# EasyEDA Pro project DRV8701视觉双驱（1）.eprj

# Schematic Schematic1
Board Name: Board1; Create Date: 2025-04-27; Page Name: P1; Project Name: DRV8701视觉双驱; Schematic Name: Schematic1; Update Date: 2025-04-28; Company: 嘉立创EDA; Page Size: A4; Version: V1.0
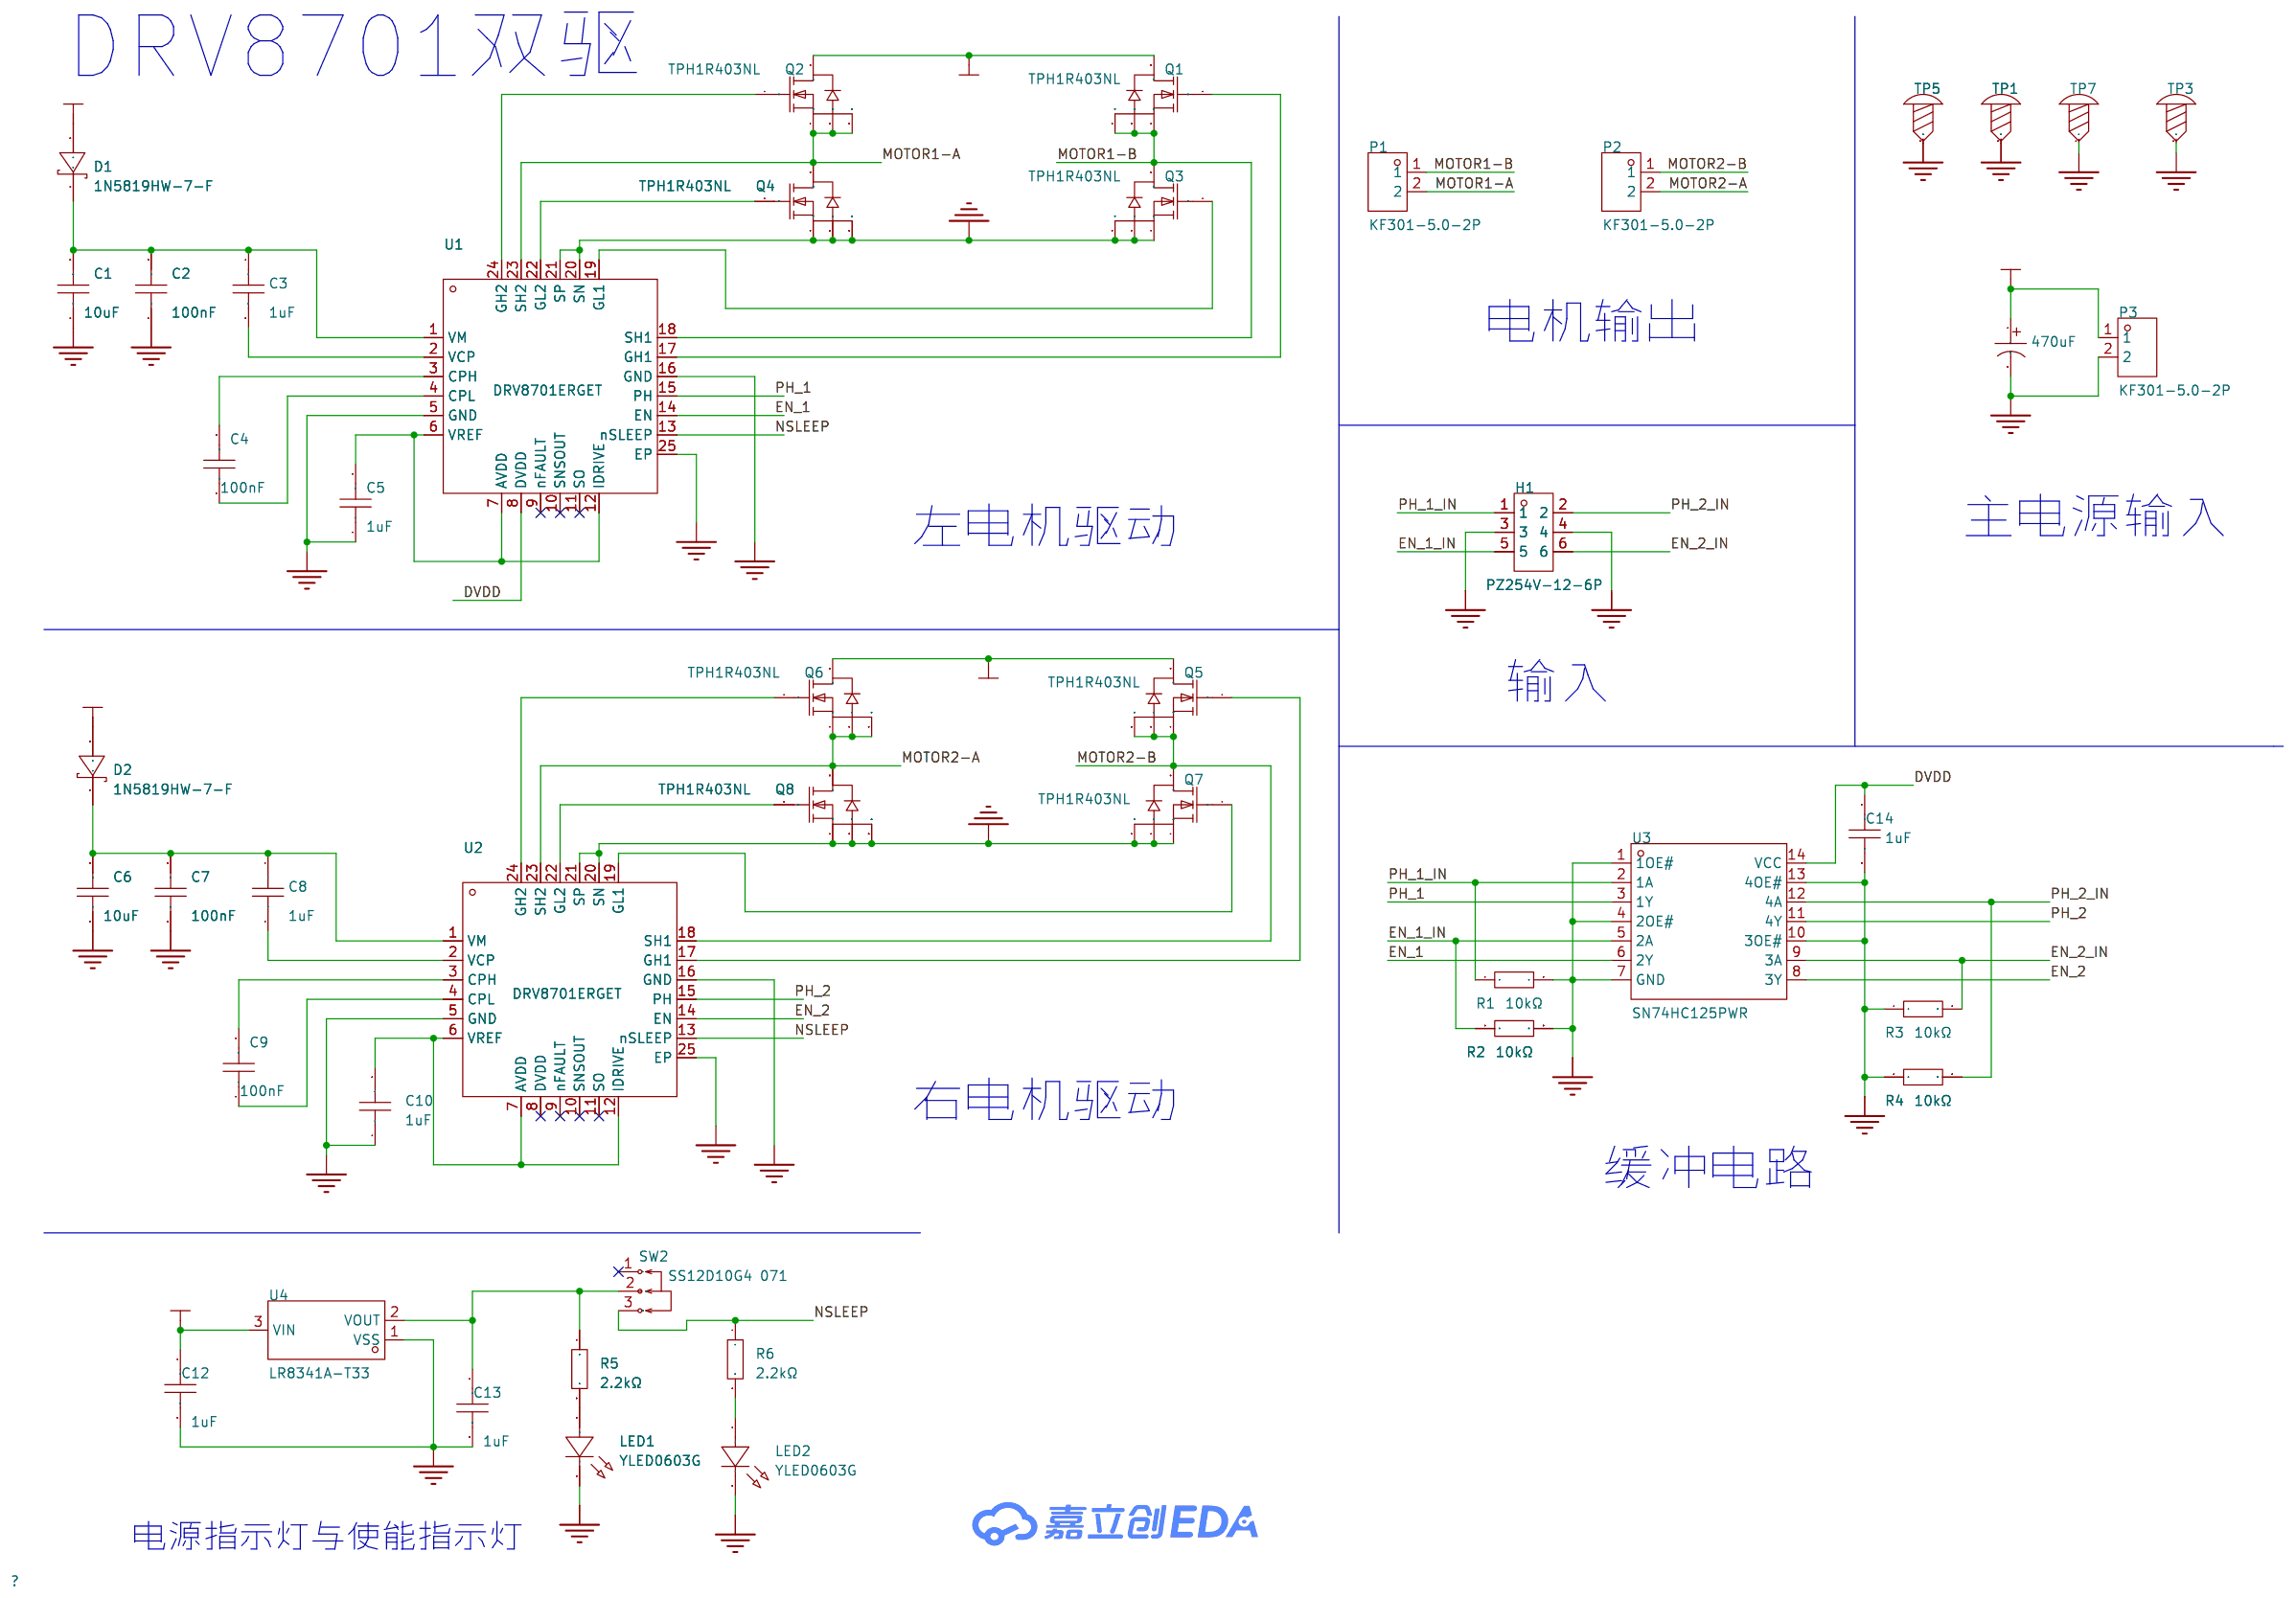
[diagram p0: schematic sheet]

## Parts
C1  10uF  [C0603]
C2  100nF  [C0603]
C3  1uF  [C0603]
C4  100nF  [C0603]
C5  1uF  [C0603]
C6  10uF  [C0603]
C7  100nF  [C0603]
C8  1uF  [C0603]
C9  100nF  [C0603]
C10  1uF  [C0603]
C12  1uF  [C0603]
C13  1uF  [C0603]
C14  1uF  [C0603]
C16  470uF  [CAP-SMD_BD10.0-L10.3-W10.3-LS11.0-R-RD]
D1  1N5819HW-7-F  [SOD-123_L2.7-W1.6-LS3.7-RD]
D2  1N5819HW-7-F  [SOD-123_L2.7-W1.6-LS3.7-RD]
H1  PZ254V-12-6P  [HDR-TH_6P-P2.54-V-M-R2-C3-S2.54]
LED1  YLED0603G  [LED0603-FD]
LED2  YLED0603G  [LED0603-FD]
P1  KF301-5.0-2P  [CONN-TH_P5.00_KF301-5.0-2P]
P2  KF301-5.0-2P  [CONN-TH_P5.00_KF301-5.0-2P]
P3  KF301-5.0-2P  [CONN-TH_P5.00_KF301-5.0-2P]
Q1  TPH1R403NL  [TDSON-8_L5.9-W5.2-P1.27-BL]
Q2  TPH1R403NL  [TDSON-8_L5.9-W5.2-P1.27-BL]
Q3  TPH1R403NL  [TDSON-8_L5.9-W5.2-P1.27-BL]
Q4  TPH1R403NL  [TDSON-8_L5.9-W5.2-P1.27-BL]
Q5  TPH1R403NL  [TDSON-8_L5.9-W5.2-P1.27-BL]
Q6  TPH1R403NL  [TDSON-8_L5.9-W5.2-P1.27-BL]
Q7  TPH1R403NL  [TDSON-8_L5.9-W5.2-P1.27-BL]
Q8  TPH1R403NL  [TDSON-8_L5.9-W5.2-P1.27-BL]
R1  10kΩ  [R0603]
R2  10kΩ  [R0603]
R3  10kΩ  [R0603]
R4  10kΩ  [R0603]
R5  2.2kΩ  [R0603]
R6  2.2kΩ  [R0603]
SW2  SS12D10G4 071  [SW-TH_SHOU-HAN_SS12D10G4]
TP1  -  [M3螺丝]
TP3  -  [M3螺丝]
TP5  -  [M3螺丝]
TP7  -  [M3螺丝]
U1  DRV8701ERGET  [VQFN-24_L4.0-W4.0-P0.50-BL-EP2.5]
U2  DRV8701ERGET  [VQFN-24_L4.0-W4.0-P0.50-BL-EP2.5]
U3  SN74HC125PWR  [TSSOP-14_L5.0-W4.4-P0.65-LS6.5-BL]
U4  LR8341A-T33  [SOT-23-3L_L2.9-W1.6-P1.90-LS2.8-BL]

## Library data of the parts
C1 C6 = GRM188Z71A106KA73D: 容值:10uF;精度:±10%;额定电压:10V;材质(温度系数):X7R;; LCSC Part Name: 10uF ±10% 10V; Supplier Part: C2959727; Manufacturer: muRata(村田); Supplier Footprint: 0603; JLCPCB Part Class: 扩展库; Datasheet: https://atta.szlcsc.com/upload/public/pdf/source/20220328/6A4892B7E841253269A84FFE395E0578.pdf; Supplier: LCSC; Tolerance: ±10%; Voltage Rated: 10V; Temperature Coefficient: X7R
C2 C4 C7 C9 = CGA0603X7R104K500JT: 容值:100nF;精度:±10%;额定电压:50V;材质(温度系数):X7R;; LCSC Part Name: 100nF ±10% 50V; Supplier Part: C6119867; Manufacturer: HRE(芯声); Supplier Footprint: 0603; JLCPCB Part Class: 扩展库; Supplier: LCSC; Tolerance: ±10%; Voltage Rated: 50V; Temperature Coefficient: X7R
C3 C5 C8 C10 C12-C14 = CGA0603X5R105K500JT: 容值:1uF;精度:±10%;额定电压:50V;材质(温度系数):X5R;; LCSC Part Name: 1uF ±10% 50V; Supplier Part: C6119852; Manufacturer: HRE(芯声); Supplier Footprint: 0603; JLCPCB Part Class: 扩展库; Supplier: LCSC; Tolerance: ±10%; Voltage Rated: 50V; Temperature Coefficient: X5R
C16 = RVT1V471M1010_C72519: 容值:470uF;精度:±20%;额定电压:35V;纹波电流:286mA@120Hz;等效串联电阻(ESR):-;; LCSC Part Name: 470uF ±20% 35V; Supplier Part: C72519; Manufacturer: ROQANG(容强); Manufacturer Part: RVT1V471M1010; Supplier Footprint: SMD,D10xL10.2mm; JLCPCB Part Class: Extended Part; Datasheet: https://atta.szlcsc.com/upload/public/pdf/source/20210128/C72519_A1B8ED607B11AD36B70B1D23AFC8819E.pdf; Supplier: LCSC; Tolerance: ±20%; Voltage Rating: 35V; Ripple Current: 286mA@120Hz; Diameter: 10mm; Height - Seated (Max): 10.2mm; Lifetime: 2000hrs@105℃; Operating Temperature: -40℃~+105℃
D1 D2 = 1N5819HW-7-F: 正向压降(Vf):450mV@1A;直流反向耐压(Vr):40V;整流电流:1A;; LCSC Part Name: 电压:40V 电流:1A; Supplier Part: C82544; Manufacturer: DIODES(美台); Supplier Footprint: SOD-123; JLCPCB Part Class: 扩展库; Datasheet: https://atta.szlcsc.com/upload/public/pdf/source/20161024/1477288459223.pdf; Supplier: LCSC; Forward Voltage (Vf@If): 450mV@1A; Reverse Voltage (Vr): 40V; Rectified Current: 1A; Reverse Leakage Current (Ir): 1mA@40V
H1 = PZ254V-12-6P: 插针结构:2x3P;间距:2.54mm;行距:2.54mm;圆针/方针:方针;安装类型:直插;排数:双排;总PIN位数:6P;额定电流:-;额定电压:-;配合针长度:6mm;塑高:2.5mm;端接针长度:3mm;触头材质:黄铜;触头镀层:-;工作温度范围:-40℃~+105℃;颜色:黑色;; LCSC Part Name: 间距:2.54mm 2x3P 直插 方针; Supplier Part: C492420; Manufacturer: XFCN(兴飞); Supplier Footprint: 插件,P=2.54mm; JLCPCB Part Class: 扩展库; Datasheet: https://atta.szlcsc.com/upload/public/pdf/source/20200309/C492420_BAECB307B001054C09D200388220EAE6.pdf; Supplier: LCSC; Pin Structure: 2x3P; Pitch: 2.54mm; Row Spacing: 2.54mm; Circluar Pins/Square Pins: 方针; Mounting Type: 直插; Number of Rows: 双排; Number of Pins: 6P; Length of Mating Pin: 6mm; Insulation Height: 2.5mm; Length of End Connection Pin: 3mm; Contact Material: 黄铜; Operating Temperature Range: -40℃~+105℃; Color: 黑色
LED1 LED2 = YLED0603G: 发光颜色:翠绿色;正向电压(VF):2.7V~3.2V;功率:-;正向电流:25mA;主波长:510nm~531nm;二极管配置:-;透镜颜色:-;色温:-;发光强度:-;发光角度:-;载带方式:-;工作温度:-40℃~+85℃;; Supplier Part: C19273151; Manufacturer: YONGYUTAI(永裕泰); Supplier Footprint: 0603; JLCPCB Part Class: 扩展库; Datasheet: https://atta.szlcsc.com/upload/public/pdf/source/20231201/6896CD173B7817C61CFF421DECB2B9C4.pdf; Supplier: LCSC; Emitted Color: 翠绿色; Forward Voltage (VF): 2.7V~3.2V; Forward Current: 25mA; Dominant Wavelength: 510nm~531nm; Operating Temperature: -40℃~+85℃
P1-P3 = KF301-5.0-2P: 结构:1x2P;间距:5mm;颜色:蓝色;安装方式:直插;额定电流:17A;额定电压:250V;排数:1;线规 - AWG:14~22;线规 - 平方毫米:1.5;每排PIN数:2;工作温度范围:-30℃~+120℃;; LCSC Part Name: 5mm 1x2P 排数:1 每排P数:2 直插; Supplier Part: C474881; Manufacturer: KEFA(科发); Supplier Footprint: 插件,P=5mm; JLCPCB Part Class: 扩展库; Datasheet: https://atta.szlcsc.com/upload/public/pdf/source/20230317/03A5B5FC229D6F9225E8F51DA1A4E80A.pdf; Supplier: LCSC; Structure: 1x2P; Pitch: 5mm; Color: 蓝色; Mounting Style: 直插; Current Rating (Max): 17A; Voltage Rating (Max): 250V; Number of Pins: 2P; Number of Rows: 1; Wire Gauge - AWG: 14~22; Wire Gauge - mm2: 1.5; Number of PINs Per Row: 2; Operating Temperature Range: -30℃~+120℃
Q1-Q8 = TPH1R403NL_C19268167: 漏源电压(Vdss):30V;连续漏极电流(Id):150A;导通电阻(RDS(on)@Vgs,Id):3.3mΩ@4.5V,20A;功率(Pd):75W;阈值电压(Vgs(th)@Id):3V@250uA;; LCSC Part Name: 耐压:30V 电流:150A; Supplier Part: C19268167; Manufacturer: TECH PUBLIC(台舟); JLCPCB Part Class: 扩展库; Datasheet: https://atta.szlcsc.com/upload/public/pdf/source/20231201/E668D9B30DA1C5FDF2CA4EE637776407.pdf; Supplier: LCSC; Drain Source Voltage (Vdss): 30V; Continuous Drain Current (Id): 150A; Drain Source On Resistance (RDS(on)@Vgs,Id): 3.3mΩ@4.5V,20A; Power Dissipation (Pd): 75W; Gate Threshold Voltage (Vgs(th)@Id): 3V@250uA; Total Gate Charge (Qg@Vgs): 58nC@15V; Input Capacitance (Ciss@Vds): 5.93nF@15V; Reverse Transfer Capacitance (Crss@Vds): 220pF@15V; Operating Temperature: -55℃~+150℃
R1-R4 = 0603WAF1002T5E: 电阻类型:厚膜电阻;阻值:10kΩ;精度:±1%;功率:100mW;最大工作电压:75V;温度系数:±100ppm/℃;; LCSC Part Name: 厚膜电阻 10kΩ ±1% 100mW; Supplier Part: C25804; Manufacturer: UNI-ROYAL(厚声); Supplier Footprint: 0603; JLCPCB Part Class: 基础库; Datasheet: https://atta.szlcsc.com/upload/public/pdf/source/20200306/C422600_1E6D84923E4A46A82E41ADD87F860B5C.pdf; Supplier: LCSC; Type: 厚膜电阻; Tolerance: ±1%; Power(Watts): 100mW; Overload Voltage (Max): 75V; Temperature Coefficient: ±100ppm/℃; Operating Temperature Range: -55℃~+155℃
R5 R6 = 0603WAF2201T5E: 电阻类型:厚膜电阻;阻值:2.2kΩ;精度:±1%;功率:100mW;最大工作电压:75V;温度系数:±100ppm/℃;; LCSC Part Name: 2.2kΩ ±1% 100mW 厚膜电阻; Supplier Part: C4190; Manufacturer: UNI-ROYAL(厚声); Supplier Footprint: 0603; JLCPCB Part Class: 基础库; Datasheet: https://atta.szlcsc.com/upload/public/pdf/source/20200306/C422600_1E6D84923E4A46A82E41ADD87F860B5C.pdf; Supplier: LCSC; Type: 厚膜电阻; Tolerance: ±1%; Power(Watts): 100mW; Overload Voltage (Max): 75V; Temperature Coefficient: ±100ppm/℃; Operating Temperature Range: -55℃~+155℃
SW2 = SS12D10G4 071: 电路结构:单刀双掷;安装方式:直插;开关颜色:-;额定电流(DC):2A;额定电压(DC):125V;额定电流(AC):-;额定电压(AC):-;机械寿命:3千次;; Supplier Part: C2887259; Manufacturer: SHOU HAN(首韩); Supplier Footprint: 插件; JLCPCB Part Class: 扩展库; Datasheet: https://atta.szlcsc.com/upload/public/pdf/source/20210820/80D1704BBF3FCEE0435FCAA54C61E0A3.pdf; Supplier: LCSC; Circuit: 单刀双掷; Pin Style: PC引脚; Switch Length: 12.7mm; Switch Width: 6.7mm; Switch Height: 6.4mm; Mounting Style: 直插; Current Rating (DC): 2A; Voltage Rating (DC): 125V; Mechanical Life: 3千次; Operating Temperature: -16℃~+60℃
TP1 TP3 TP5 TP7 = M3螺丝: Supplier Footprint: 插件
U1 U2 = DRV8701ERGET: DRV8701 47V H 桥智能栅极驱动器; LCSC Part Name: 有刷直流电机驱动芯片 5.5V; Supplier Part: C132049; Manufacturer: TI(德州仪器); Supplier Footprint: VQFN-24(4x4); JLCPCB Part Class: 扩展库; Datasheet: https://www.ti.com/cn/lit/gpn/drv8701; Supplier: LCSC
U3 = SN74HC125PWR: 输入类型:-;电源电压:2V~6V;元件数:4;每个元件位数:1;灌电流(IOL):7.8mA;拉电流(IOH):7.8mA;; Supplier Part: C132994; Manufacturer: TI(德州仪器); Supplier Footprint: TSSOP-14; JLCPCB Part Class: 扩展库; Datasheet: https://www.ti.com/cn/lit/gpn/sn74hc125; Supplier: LCSC; output type: 三态; Supply Voltage: 2V~6V; Number of Elements: 4; Number of Bits per Element: 1; Sink Current: 7.8mA; Source Current: 7.8mA; Logic Family: 74HC; Operating Temperature: -40℃~+85℃
U4 = LR8341A-T33: 输出类型:固定;最大输入电压:40V;输出电压:3.3V;最大输出电流:100mA;电源纹波抑制比(PSRR):55dB@(1kHz);输出极性:正极;; LCSC Part Name: 输入40V 输出3.3V 100mA; Supplier Part: C2829465; Manufacturer: LR(朗瑞); Supplier Footprint: SOT-23-3L; JLCPCB Part Class: 扩展库; Datasheet: https://atta.szlcsc.com/upload/public/pdf/source/20210426/C2829465_61F15D7ACE9671B48D4F69A8092B0D8F.pdf; Supplier: LCSC; Output Type: 固定; Maximum Input Voltage: 40V; Output Voltage: 3.3V; MAX Output Current: 100mA; Power Supply Rejection Ratio (PSRR): 55dB@(1kHz); standby current: 2uA; Operating Temperature: -40℃~+85℃; Output Polarity: 正极; Number of Outputs: 1

## Nets
DVDD: C14.1 U1.8(DVDD) U3.14(VCC)
GND: C1.1 C2.1 C5.1 C6.1 C7.1 C10.1 C12.2 C13.2 C14.2 C16.2 H1.3 H1.4 LED1.2(-) LED2.2(-) P3.2 Q3.1(S) Q3.2(S) Q3.3(S) Q4.1(S) Q4.2(S) Q4.3(S) Q7.1(S) Q7.2(S) Q7.3(S) Q8.1(S) Q8.2(S) Q8.3(S) R1.2 R2.2 R3.1 R4.1 TP1.1 TP3.1 TP5.1 TP7.1 U1.5(GND) U1.16(GND) U1.20(SN) U1.21(SP) U1.25(EP) U2.5(GND) U2.16(GND) U2.20(SN) U2.21(SP) U2.25(EP) U3.1(1OE#) U3.4(2OE#) U3.7(GND) U3.10(3OE#) U3.13(4OE#) U4.1(VSS)
VIN: C12.1 C16.1 D1.2(A) D2.2(A) P3.1 Q1.5(D) Q2.5(D) Q5.5(D) Q6.5(D) U4.3(VIN)
EN_1: U1.14(EN) U3.6(2Y)
EN_1_IN: H1.5 R2.1 U3.5(2A)
EN_2: U2.14(EN) U3.8(3Y)
EN_2_IN: H1.6 R3.2 U3.9(3A)
MOTOR1-A: P1.2 Q2.1(S) Q2.2(S) Q2.3(S) Q4.5(D) U1.23(SH2)
MOTOR1-B: P1.1 Q1.1(S) Q1.2(S) Q1.3(S) Q3.5(D) U1.18(SH1)
MOTOR2-A: P2.2 Q6.1(S) Q6.2(S) Q6.3(S) Q8.5(D) U2.23(SH2)
MOTOR2-B: P2.1 Q5.1(S) Q5.2(S) Q5.3(S) Q7.5(D) U2.18(SH1)
NSLEEP: R6.1 SW2.3 U1.13(nSLEEP) U2.13(nSLEEP)
PH_1: U1.15(PH) U3.3(1Y)
PH_1_IN: H1.1 R1.1 U3.2(1A)
PH_2: U2.15(PH) U3.11(4Y)
PH_2_IN: H1.2 R4.2 U3.12(4A)
$1N2345: LED1.1(+) R5.2
$1N2354: LED2.1(+) R6.2
$1N2355: C13.1 R5.1 SW2.2 U4.2(VOUT)
$1N2405: Q5.4(G) U2.17(GH1)
$1N2409: Q8.4(G) U2.22(GL2)
$1N2412: Q6.4(G) U2.24(GH2)
$1N2413: Q7.4(G) U2.19(GL1)
$1N2415: C10.2 U2.6(VREF) U2.7(AVDD) U2.12(IDRIVE)
$1N2417: C9.1 U2.4(CPL)
$1N2418: C9.2 U2.3(CPH)
$1N2420: C8.2 U2.2(VCP)
$1N2421: C6.2 C7.2 C8.1 D2.1(K) U2.1(VM)
$1N2430: Q1.4(G) U1.17(GH1)
$1N2434: Q4.4(G) U1.22(GL2)
$1N2437: Q2.4(G) U1.24(GH2)
$1N2438: Q3.4(G) U1.19(GL1)
$1N2442: C5.2 U1.6(VREF) U1.7(AVDD) U1.12(IDRIVE)
$1N2444: C4.1 U1.4(CPL)
$1N2445: C4.2 U1.3(CPH)
$1N2447: C3.2 U1.2(VCP)
$1N2448: C1.2 C2.2 C3.1 D1.1(K) U1.1(VM)

Not connected (* = marked no-connect by the designer): SW2 1*; U1 9(nFAULT)* 10(SNSOUT)* 11(SO)*; U2 8(DVDD)* 9(nFAULT)* 10(SNSOUT)* 11(SO)*

## Notes on the sheet
- DRV8701双驱
- 电机输出
- 左电机驱动
- 主电源输入
- 输入
- 右电机驱动
- 缓冲电路
- 电源指示灯与使能指示灯

# Board PCB1
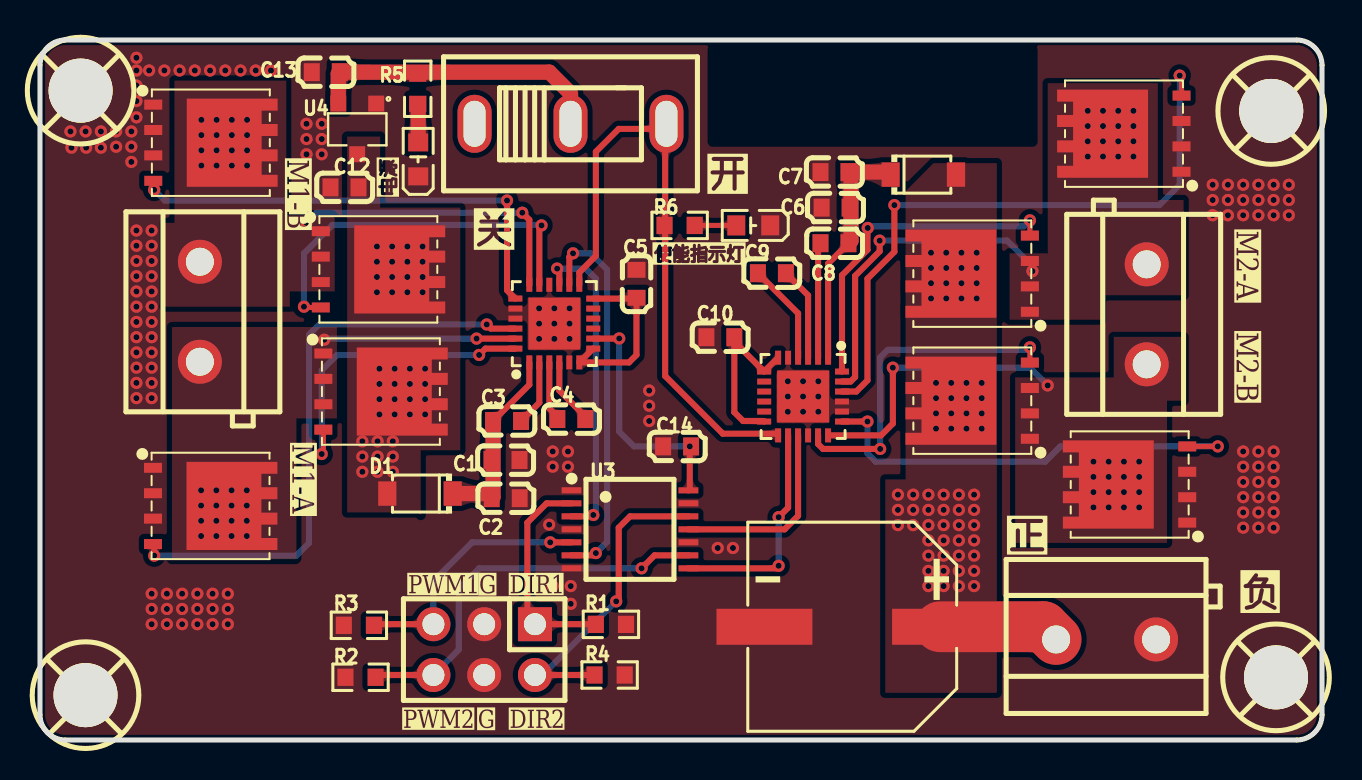
[diagram p1: board, top side]
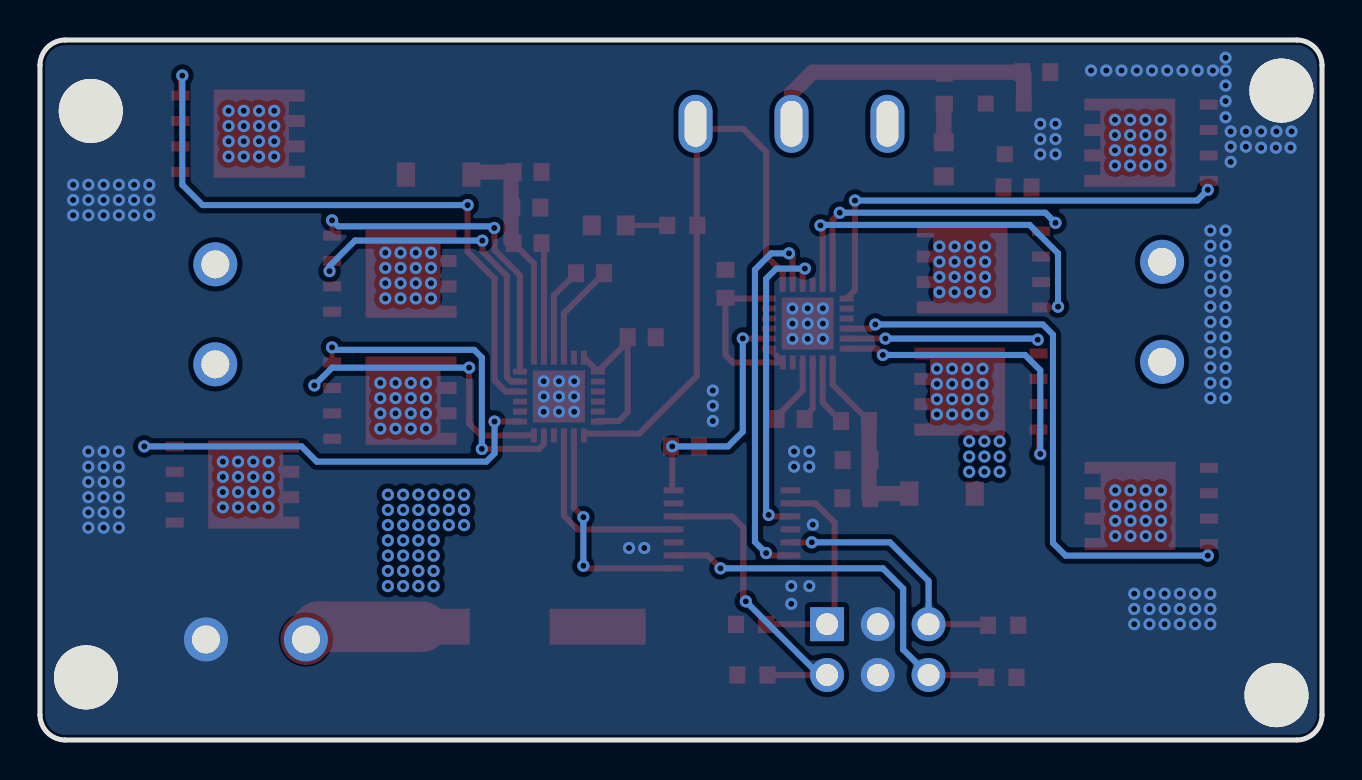
[diagram p2: board, bottom side, seen from below]

Outline 64.14 x 35 mm; copper layers: Top Layer, Inner1, Inner2, Bottom Layer. Coordinates in mm from the lower left corner of the outline.
Outline path: 0,33.73 0,1.27 arc(0.37,0.37) 1.27,0 62.87,0 arc(63.77,0.37) 64.14,1.27 64.14,33.73 arc(63.77,34.63) 62.87,35 1.27,35 arc(0.37,34.63) 0,33.73
Stack: Top Layer 0.035mm 外层铜厚1oz / Dielectric1 0.2104mm 7628 RC49% 8.6mil / Inner1 0.0152mm 内层铜厚 / Dielectric2 1.065mm 1.1mm H/HOZ Copper / Inner2 0.0152mm 内层铜厚 / Dielectric3 0.2104mm 7628 RC49% 8.6mil / Bottom Layer 0.035mm 外层铜厚1oz

## Design rules (mm)
template: 自定义配置
spacing copperThickness1oz (default): track to track 0.102, other pairs 0.152 to 0.3
spacing copperThickness2oz: track to track 0.203, other pairs 0.152 to 0.3
track width copperThickness1oz (default): min 0.127, default 0.254, max 2.54
track width copperThickness2oz: min 0.203, default 0.254, max 2.54
differential pair differentialPair (default): width min 0.127, default 0.254, max 2.54; gap min 0.152, default 0.152
via viaSize (default): diameter min 0.5, default 0.61, max 10; hole min 0.3, default 0.305, max 6.3

## Placement (name value [footprint] x y rotation side)
C1  10uF  [C0603]  23.3 12.09 180 top
C2  100nF  [C0603]  23.29 14 180 top
C3  1uF  [C0603]  23.37 15.95 0 top
C4  100nF  [C0603]  26.58 16.05 180 top
C5  1uF  [C0603]  29.84 22.81 270 top
C6  10uF  [C0603]  39.81 26.62 0 top
C7  100nF  [C0603]  39.75 28.4 0 top
C8  1uF  [C0603]  39.75 24.84 180 top
C9  100nF  [C0603]  36.62 23.34 0 top
C10  1uF  [C0603]  34.04 20.14 0 top
C12  1uF  [C0603]  15.24 27.63 180 top
C13  1uF  [C0603]  14.3 33.39 180 top
C14  1uF  [C0603]  31.88 14.68 180 top
C16  470uF  [CAP-SMD_BD10.0-L10.3-W10.3-LS11.0-R-RD]  40.64 5.66 0 top
D1  1N5819HW-7-F  [SOD-123_L2.7-W1.6-LS3.7-RD]  19.01 12.32 180 top
D2  1N5819HW-7-F  [SOD-123_L2.7-W1.6-LS3.7-RD]  44.2 28.27 0 top
H1  PZ254V-12-6P  [HDR-TH_6P-P2.54-V-M-R2-C3-S2.54]  22.23 4.52 180 top
LED1  YLED0603G  [LED0603-FD]  18.92 29.03 270 top
LED2  YLED0603G  [LED0603-FD]  35.69 25.73 0 top
P1  KF301-5.0-2P  [CONN-TH_P5.00_KF301-5.0-2P]  8 21.41 270 top
P2  KF301-5.0-2P  [CONN-TH_P5.00_KF301-5.0-2P]  55.37 21.28 90 top
P3  KF301-5.0-2P  [CONN-TH_P5.00_KF301-5.0-2P]  53.34 5.03 0 top
Q1  TPH1R403NL  [TDSON-8_L5.9-W5.2-P1.27-BL]  15.83 23.53 270 top
Q2  TPH1R403NL  [TDSON-8_L5.9-W5.2-P1.27-BL]  15.95 17.42 270 top
Q3  TPH1R403NL  [TDSON-8_L5.9-W5.2-P1.27-BL]  7.44 29.86 270 top
Q4  TPH1R403NL  [TDSON-8_L5.9-W5.2-P1.27-BL]  7.43 11.7 270 top
Q5  TPH1R403NL  [TDSON-8_L5.9-W5.2-P1.27-BL]  47.75 16.97 90 top
Q6  TPH1R403NL  [TDSON-8_L5.9-W5.2-P1.27-BL]  47.75 23.32 90 top
Q7  TPH1R403NL  [TDSON-8_L5.9-W5.2-P1.27-BL]  55.63 12.77 90 top
Q8  TPH1R403NL  [TDSON-8_L5.9-W5.2-P1.27-BL]  55.34 30.32 90 top
R1  10kΩ  [R0603]  28.57 5.78 0 top
R2  10kΩ  [R0603]  15.96 5.73 180 top
R3  10kΩ  [R0603]  16.04 3.14 0 top
R4  10kΩ  [R0603]  28.5 3.25 180 top
R5  2.2kΩ  [R0603]  18.9 32.56 270 top
R6  2.2kΩ  [R0603]  32 25.73 0 top
SW2  SS12D10G4 071  [SW-TH_SHOU-HAN_SS12D10G4]  26.54 30.81 0 top
TP1  -  [M3螺丝]  2.1 32.41 0 top
TP3  -  [M3螺丝]  61.91 3.07 0 top
TP5  -  [M3螺丝]  61.67 31.39 0 top
TP7  -  [M3螺丝]  2.34 2.18 0 top
U1  DRV8701ERGET  [VQFN-24_L4.0-W4.0-P0.50-BL-EP2.5]  25.73 20.82 0 top
U2  DRV8701ERGET  [VQFN-24_L4.0-W4.0-P0.50-BL-EP2.5]  38.18 17.17 180 top
U3  SN74HC125PWR  [TSSOP-14_L5.0-W4.4-P0.65-LS6.5-BL]  29.52 10.53 270 top
U4  LR8341A-T33  [SOT-23-3L_L2.9-W1.6-P1.90-LS2.8-BL]  15.87 30.55 180 top

## Footprints (pads in the part's own frame, mm; a bottom-side part is the same pattern mirrored in y, then rotated)
C0603
  rect 0.8x0.9 smd: 1(-0.7,0) 2(0.7,0)
CAP-SMD_BD10.0-L10.3-W10.3-LS11.0-R-RD
  rect 4.8x1.8 smd: 1(4.395,0) 2(-4.395,0)
CONN-TH_P5.00_KF301-5.0-2P
  round 2.2 hole 1.4: 1(-2.5,0) 2(2.5,0)
HDR-TH_6P-P2.54-V-M-R2-C3-S2.54
  rect 1.7x1.7 hole 1.1: 1(-2.54,-1.27)
  round 1.7 hole 1.1: 2(-2.54,1.27) 3(0,-1.27) 4(0,1.27) 5(2.54,-1.27) 6(2.54,1.27)
LED0603-FD
  rect 0.9x1 smd: 1(-0.85,0) 2(0.85,0)
M3螺丝
  round 3.2 hole 3.2: 1(-0.064,0.064)
R0603
  rect 0.806x0.864 smd: 1(-0.753,0) 2(0.753,0)
SOD-123_L2.7-W1.6-LS3.7-RD
  rect 0.91x1.22 smd: 1(-1.635,0) 2(1.635,0)
SOT-23-3L_L2.9-W1.6-P1.90-LS2.8-BL
  rect 0.8x0.8 smd: 1(-0.95,-1.265) 2(0.95,-1.265) 3(0.005,1.265)
SW-TH_SHOU-HAN_SS12D10G4
  oval 1.7x2.9 hole 1.1x2.3: 1(-4.8,0) 2(0,0) 3(4.8,0)
TDSON-8_L5.9-W5.2-P1.27-BL
  rect 0.5x0.9 smd: 1(-1.905,-1.775) 2(-0.635,-1.775) 3(0.635,-1.775) 4(1.905,-1.775)
  custom 4.41x4.55 smd: 5(0,1.775)
TSSOP-14_L5.0-W4.4-P0.65-LS6.5-BL
  rect 0.305x0.991 smd: 1(-1.95,-2.925) 2(-1.3,-2.925) 3(-0.65,-2.925) 4(0,-2.925) 5(0.65,-2.925) 6(1.3,-2.925) 7(1.95,-2.925) 8(1.95,2.925) 9(1.3,2.925) 10(0.65,2.925) 11(0,2.925) 12(-0.65,2.925) 13(-1.3,2.925) 14(-1.95,2.925)
VQFN-24_L4.0-W4.0-P0.50-BL-EP2.5
  rect 0.3x0.7 smd: 1(-1.25,-1.942) 2(-0.75,-1.942) 3(-0.25,-1.942) 4(0.25,-1.942) 5(0.75,-1.942) 6(1.25,-1.942) 13(1.25,1.942) 14(0.75,1.942) 15(0.25,1.942) 16(-0.25,1.942) 17(-0.75,1.942) 18(-1.25,1.942)
  rect 0.7x0.3 smd: 7(1.948,-1.25) 8(1.948,-0.75) 9(1.948,-0.25) 10(1.948,0.25) 11(1.948,0.75) 12(1.948,1.25) 19(-1.948,1.25) 20(-1.948,0.75) 21(-1.948,0.25) 22(-1.948,-0.25) 23(-1.948,-0.75) 24(-1.948,-1.25)
  rect 2.6x2.6 smd: 25(0.001,-0.001)

## Nets
As in the schematic.

Pads without a net: SW2 1; U1 9 10 11; U2 8 9 10 11

## Via types
v1: diameter 0.61, hole 0.305, Top Layer to Bottom Layer, 346 vias

## Routing (per net, layer and track width the routed paths; a pad name or vN(x,y) marks a point on that pad's centre or on a via; arc(x,y) is an arc through that point)
DVDD: length 12
  Top Layer w0.305: v1(32.51,14.68) 32.51,12.55 32.44,12.48 ; v1(28.98,20.08) 28.97,20.07 U1.8
  Bottom Layer w0.305: v1(28.98,20.08) 28.98,15.42 29.72,14.68 v1(32.51,14.68)
GND:
  vias: v1(1.52,30.43) v1(1.58,29.62) v1(2.28,30.43) v1(2.31,29.62) v1(3.05,30.43) v1(3.05,29.62) v1(3.81,30.43) v1(3.81,29.66) v1(4.57,30.43) v1(4.57,29.67) v1(4.57,28.9) v1(4.83,34.11) v1(4.83,33.48) v1(4.83,32.72) v1(4.83,31.95) v1(4.83,31.13) v1(4.83,25.47) v1(4.83,24.71) v1(4.83,23.95) v1(4.83,23.19) v1(4.83,22.43) v1(4.83,21.66) v1(4.83,20.9) v1(4.83,20.14) v1(4.83,19.38) v1(4.83,18.62) v1(4.83,17.85) v1(4.83,17.09) v1(5.46,33.48) v1(5.59,25.47) v1(5.59,24.71) v1(5.59,23.95) v1(5.59,23.19) v1(5.59,22.43) v1(5.59,21.66) v1(5.59,20.9) v1(5.59,20.14) v1(5.59,19.38) v1(5.59,18.62) v1(5.59,17.85) v1(5.59,17.09) v1(5.59,7.31) v1(5.59,6.55) v1(5.59,5.79) v1(6.22,33.48) v1(6.35,7.31) v1(6.35,6.55) v1(6.35,5.79) v1(6.98,33.48) v1(7.11,7.31) v1(7.11,6.55) v1(7.11,5.79) v1(7.75,33.48) v1(7.87,7.31) v1(7.87,6.55) v1(7.87,5.79) v1(8.51,33.48) v1(8.64,7.31) v1(8.64,6.55) v1(8.64,5.79) v1(9.27,33.48) v1(9.4,7.31) v1(9.4,6.55) v1(9.4,5.79) v1(10.03,33.48) v1(10.8,33.48) v1(11.56,33.48) v1(13.33,30.81) v1(13.33,30.05) v1(13.33,29.28) v1(14.1,30.81) v1(14.1,30.05) v1(14.1,29.28) v1(24.97,21.58) v1(24.97,20.82) v1(24.97,20.06) v1(25.48,10.77) v1(25.65,14.43) v1(25.65,13.66) v1(25.65,7.69) v1(25.73,21.58) v1(25.73,20.82) v1(25.73,20.06) v1(26.42,14.43) v1(26.42,13.66) v1(26.5,21.58) v1(26.5,20.82) v1(26.5,20.06) v1(26.55,7.69) v1(26.55,6.81) v1(30.48,17.47) v1(30.48,16.71) v1(30.48,15.95) v1(33.91,9.6) v1(34.67,9.6) v1(37.42,17.94) v1(37.42,17.17) v1(37.42,16.41) v1(38.18,17.94) v1(38.18,17.17) v1(38.18,16.41) v1(38.94,17.94) v1(38.94,17.17) v1(38.94,16.41) v1(58.67,27.76) v1(58.67,27) v1(58.67,26.24) v1(59.44,27.76) v1(59.44,27) v1(59.44,26.24) v1(60.2,27.76) v1(60.2,27) v1(60.2,26.24) v1(60.2,14.43) v1(60.2,13.66) v1(60.2,12.9) v1(60.2,12.14) v1(60.2,11.38) v1(60.2,10.62) v1(60.96,27.76) v1(60.96,27) v1(60.96,26.24) v1(60.96,14.43) v1(60.96,13.66) v1(60.96,12.9) v1(60.96,12.14) v1(60.96,11.38) v1(60.96,10.62) v1(61.72,27.76) v1(61.72,27) v1(61.72,26.24) v1(61.72,14.43) v1(61.72,13.66) v1(61.72,12.9) v1(61.72,12.14) v1(61.72,11.38) v1(61.72,10.62) v1(62.48,27.76) v1(62.48,27) v1(62.48,26.24)
VIN: length 6.1
  Top Layer w2.54: P3.1 50.2,5.66 C16.1
  vias: v1(16.13,14.93) v1(16.13,14.17) v1(16.13,13.41) v1(16.86,24.67) v1(16.86,23.91) v1(16.86,23.15) v1(16.86,22.39) v1(16.98,18.57) v1(16.98,17.8) v1(16.98,17.04) v1(16.98,16.28) v1(16.89,14.93) v1(16.89,14.17) v1(16.89,13.41) v1(17.62,24.67) v1(17.62,23.91) v1(17.62,23.15) v1(17.62,22.39) v1(17.65,14.93) v1(17.65,14.17) v1(17.65,13.41) v1(17.75,18.57) v1(17.75,17.8) v1(17.75,17.04) v1(17.75,16.28) v1(18.38,24.67) v1(18.38,23.91) v1(18.38,23.15) v1(18.38,22.39) v1(18.51,18.57) v1(18.51,17.8) v1(18.51,17.04) v1(18.51,16.28) v1(19.14,24.67) v1(19.14,23.91) v1(19.14,23.15) v1(19.14,22.39) v1(19.27,18.57) v1(19.27,17.8) v1(19.27,17.04) v1(19.27,16.28) v1(42.93,12.27) v1(42.93,11.5) v1(42.93,10.74) v1(43.69,12.27) v1(43.69,11.5) v1(43.69,10.74) v1(44.45,12.27) v1(44.45,11.5) v1(44.45,10.74) v1(44.45,9.98) v1(44.45,9.22) v1(44.45,8.46) v1(44.45,7.69) v1(44.58,24.36) v1(44.58,23.6) v1(44.58,22.84) v1(44.58,22.08) v1(44.83,17.85) v1(44.83,17.09) v1(44.83,16.33) v1(44.83,15.57) v1(45.21,12.27) v1(45.21,11.5) v1(45.21,10.74) v1(45.21,9.98) v1(45.21,9.22) v1(45.21,8.46) v1(45.21,7.69) v1(45.34,24.36) v1(45.34,23.6) v1(45.34,22.84) v1(45.34,22.08) v1(45.59,17.85) v1(45.59,17.09) v1(45.59,16.33) v1(45.59,15.57) v1(45.97,12.27) v1(45.97,11.5) v1(45.97,10.74) v1(45.97,9.98) v1(45.97,9.22) v1(45.97,8.46) v1(45.97,7.69) v1(46.1,24.36) v1(46.1,23.6) v1(46.1,22.84) v1(46.1,22.08) v1(46.36,17.85) v1(46.36,17.09) v1(46.36,16.33) v1(46.36,15.57) v1(46.74,12.27) v1(46.74,11.5) v1(46.74,10.74) v1(46.74,9.98) v1(46.74,9.22) v1(46.74,8.46) v1(46.74,7.69) v1(46.87,24.36) v1(46.87,23.6) v1(46.87,22.84) v1(46.87,22.08) v1(47.12,17.85) v1(47.12,17.09) v1(47.12,16.33) v1(47.12,15.57)
EN_1: length 19.4
  Top Layer w0.305: v1(26.67,24.33) 26.48,24.15 U1.14 ; v1(27.81,9.35) 27.7,9.23 U3.6
  Bottom Layer w0.305: v1(27.81,9.35) 28.37,9.91 28.37,23.52 27.56,24.33 v1(26.67,24.33)
EN_1_IN: length 12.9
  Top Layer w0.305: U3.5 v1(25.53,9.88) ; R2.1 16.76,5.79 H1.5
  Bottom Layer w0.305: v1(25.53,9.88) 21.62,9.88 19.68,7.95 H1.5
EN_2: length 11.3
  Top Layer w0.305: 32.44,8.58 36.83,8.58 v1(36.96,8.71) ; v1(36.96,11.14) 37.43,11.62 U2.14
  Bottom Layer w0.305: v1(36.96,8.71) v1(36.96,11.14)
EN_2_IN: length 20
  Top Layer w0.305: v1(30.1,8.58) 30.75,9.23 32.44,9.23 ; H1.6 16.91,3.25 R3.2
  Bottom Layer w0.305: v1(30.1,8.58) 21.97,8.58 20.95,7.57 20.95,4.52 H1.6
MOTOR1-A: length 9.6
  Top Layer w0.305: U1.23 v1(21.84,20.07)
  Bottom Layer w0.305: v1(14.22,20.01) 14.28,20.07 v1(21.84,20.07)
  vias: v1(8.06,12.48) v1(8.06,11.72) v1(8.06,10.96) v1(8.06,10.2) v1(8.82,12.48) v1(8.82,11.72) v1(8.82,10.96) v1(8.82,10.2) v1(9.59,12.48) v1(9.59,11.72) v1(9.59,10.96) v1(9.59,10.2) v1(10.35,12.48) v1(10.35,11.72) v1(10.35,10.96) v1(10.35,10.2)
MOTOR1-B: length 14.8
  Top Layer w0.305: U1.18 24.48,26.01 v1(24.13,26.36)
  Bottom Layer w0.305: v1(24.13,26.36) 13.84,26.36 v1(13.33,25.86)
  vias: v1(8.08,31.01) v1(8.08,30.25) v1(8.08,29.48) v1(8.08,28.72) v1(8.84,31.01) v1(8.84,30.25) v1(8.84,29.48) v1(8.84,28.72) v1(9.6,31.01) v1(9.6,30.25) v1(9.6,29.48) v1(9.6,28.72) v1(10.36,31.01) v1(10.36,30.25) v1(10.36,29.48) v1(10.36,28.72)
MOTOR2-A: length 16.5
  Top Layer w0.305: v1(42.01,24.97) 42.01,24.43 40.78,23.2 40.78,18.15 40.56,17.92 U2.23
  Bottom Layer w0.305: v1(49.66,23.44) 49.66,23.7 48.38,24.97 42.02,24.97 v1(42.01,24.97)
  vias: v1(52.42,31.46) v1(52.42,30.7) v1(52.42,29.94) v1(52.42,29.17) v1(53.18,31.46) v1(53.18,30.7) v1(53.18,29.94) v1(53.18,29.17) v1(53.95,31.46) v1(53.95,30.7) v1(53.95,29.94) v1(53.95,29.17) v1(54.71,31.46) v1(54.71,30.7) v1(54.71,29.94) v1(54.71,29.17)
MOTOR2-B: length 14.4
  Top Layer w0.305: v1(42.67,18.62) 42.67,15.82 42.08,15.23 U2.18
  Bottom Layer w0.305: v1(50.42,17.73) 49.53,18.62 v1(42.67,18.62)
  vias: v1(52.71,13.92) v1(52.71,13.16) v1(52.71,12.39) v1(52.71,11.63) v1(53.47,13.92) v1(53.47,13.16) v1(53.47,12.39) v1(53.47,11.63) v1(54.23,13.92) v1(54.23,13.16) v1(54.23,12.39) v1(54.23,11.63) v1(54.99,13.92) v1(54.99,13.16) v1(54.99,12.39) v1(54.99,11.63)
NSLEEP: length 30.5
  Top Layer w0.305: 31.28,30.75 31.28,18.2 34.16,15.31 36.85,15.31 U2.13 ; 31.28,30.75 31.09,30.55 28.96,30.55 27.81,29.41 27.81,24.2 26.98,23.38 U1.13 ; 31.28,30.75 SW2.3
PH_1: length 16
  Top Layer w0.305: v1(27.69,11.25) 27.62,11.18 U3.3 ; U1.15 25.98,23.46 v1(25.87,23.57)
  Bottom Layer w0.305: v1(27.69,11.25) 27.81,11.38 27.81,23.06 27.3,23.57 v1(25.87,23.57)
PH_1_IN: length 10.9
  Top Layer w0.305: U3.2 25.35,11.83 24.38,10.87 24.38,6.17 H1.1 27.8,5.79 R1.1
PH_2: length 9.8
  Top Layer w0.305: U2.15 37.93,11.21 37.26,10.53 32.44,10.53
PH_2_IN: length 16
  Top Layer w0.305: H1.2 R4.2 ; v1(28.83,6.93) 28.96,7.06 28.96,10.62 29.52,11.18 32.44,11.18
  Bottom Layer w0.305: v1(28.83,6.93) 25.15,3.25 H1.2
$1N2345: length 1.9
  Top Layer w0.762: LED1.1 18.92,31.79 R5.2
$1N2354: length 2.1
  Top Layer w0.254: LED2.1 R6.2
$1N2355: length 15.1
  Top Layer w0.762: SW2.2 26.54,32.33 25.48,33.39 C13.1 14.92,33.32 U4.2
$1N2405: length 16.7
  Top Layer w0.254: v1(49.53,19.63) 49.53,18.87 Q5.4
  Top Layer w0.305: U2.17 38.93,14.8 39.18,14.55 v1(42.04,14.55)
  Bottom Layer w0.305: v1(42.04,14.55) 42.04,19.12 42.42,19.51 49.4,19.51 v1(49.53,19.63)
$1N2409: length 32
  Top Layer w0.254: Q8.4 57.12,33.13 v1(57.02,33.22)
  Top Layer w0.305: v1(42.75,26.74) 42.75,24.41 41.4,23.06 41.4,17.98 40.84,17.42 U2.22
  Bottom Layer w0.305: v1(57.02,33.22) 57.02,27.76 56.01,26.74 v1(42.75,26.74)
$1N2412: length 16.7
  Top Layer w0.254: v1(49.53,25.98) 49.53,25.22 Q6.4
  Top Layer w0.305: U2.24 40.13,23.24 41.4,24.51 41.4,25.59 v1(41.42,25.6)
  Bottom Layer w0.305: v1(49.53,25.98) 49.23,25.68 41.5,25.68 v1(41.42,25.6)
$1N2413: length 22.4
  Top Layer w0.254: Q7.4 v1(58.93,14.68)
  Top Layer w0.305: U2.19 v1(41.4,15.92)
  Bottom Layer w0.305: v1(58.93,14.68) 51.05,14.68 50.29,13.92 41.81,13.92 41.4,14.33 v1(41.4,15.92)
$1N2415: length 8.5
  Top Layer w0.305: 34.74,19.92 36.23,18.42 36.92,19.12 U2.6 ; 34.74,19.92 34.74,16.39 35.18,15.95 36.2,15.95 36.23,15.92 ; 34.74,19.92 C10.2
$1N2417: length 5.1
  Top Layer w0.305: C9.1 37.93,21.33 U2.4
$1N2418: length 4.7
  Top Layer w0.305: U2.3 38.43,22.23 C9.2
$1N2420: length 5.8
  Top Layer w0.305: C8.2 38.93,24.72 U2.2
$1N2421: length 12
  Top Layer w0.305: U2.1 39.43,23.82 C8.1
  Top Layer w0.762: C8.1 40.58,24.97 40.58,28.27 C7.2 42.43,28.4 D2.1
$1N2430: length 19
  Top Layer w0.254: Q1.4 13.25,21.63 v1(13.21,21.66)
  Top Layer w0.305: v1(25.09,25.73) 24.98,25.62 U1.17
  Bottom Layer w0.305: v1(13.21,21.66) 13.21,24.33 14.63,25.75 25.07,25.75 v1(25.09,25.73)
$1N2434: length 29.6
  Top Layer w0.305: U1.22 22.56,20.57 v1(22.35,20.78) ; Q4.4 5.72,9.74 v1(5.72,9.22)
  Bottom Layer w0.305: v1(22.35,20.78) 13.97,20.78 13.46,20.27 13.46,9.85 12.83,9.22 v1(5.72,9.22)
$1N2437: length 15.6
  Top Layer w0.254: v1(14.1,14.3) 14.18,14.38 Q2.4
  Top Layer w0.305: v1(21.97,19.25) 22.29,19.57 U1.24
  Bottom Layer w0.305: v1(14.1,14.3) 14.1,18.49 14.86,19.25 v1(21.97,19.25)
$1N2438: length 23.4
  Top Layer w0.305: U1.19 23.37,22.49 v1(23.37,26.97) ; v1(5.72,27.51) 5.72,27.91 Q3.4
  Bottom Layer w0.305: v1(23.37,26.97) 6.25,26.97 v1(5.72,27.51)
$1N2442: length 9
  Top Layer w0.305: U1.7 27.68,19.57 U1.6 29.47,18.88 29.84,19.25 C5.2 29.81,22.07 U1.12
$1N2444: length 3.4
  Top Layer w0.305: 27.41,16.05 25.98,17.48 U1.4
$1N2445: length 3
  Top Layer w0.305: U1.3 25.48,16.58 26.01,16.05
$1N2447: length 3.3
  Top Layer w0.305: C3.2 24.98,16.87 U1.2
$1N2448: length 9.6
  Top Layer w0.305: C3.1 24.48,17.77 U1.1
  Top Layer w0.762: 20.65,12.32 22.37,12.32 22.6,12.09 22.67,12.16 C3.1

## Copper pours and planes (outline as drawn; the poured copper is in the pictures)
GND on Top Layer: -3.56,37.67 66.8,37.67 66.8,-2.85 -3.56,-2.85
GND on Bottom Layer: -5.46,39.06 73.66,39.06 73.66,-8.94 -5.46,-8.94
GND on Inner2: 0.66,34.21 63.49,34.21 63.49,0.65 0.66,0.65
VIN on Top Layer: 15.37,30.17 21.03,30.17 21.03,11.25 15.37,11.25
VIN on Top Layer: 42.29,28.84 47.87,28.84 47.87,2.36 42.29,2.36
VIN on Inner1: 48.49,9.07 63.37,9.07 63.37,0.78 48.49,0.78
VIN on Inner1: 0.66,34.32 63.37,34.32 63.37,0.78 0.66,0.78
MOTOR1-A on Top Layer: 6.6,20.65 14.86,20.65 14.86,9.04 6.6,9.04
MOTOR1-B on Top Layer: 6.22,32.97 14.75,32.97 14.75,21.66 6.22,21.66
MOTOR2-A on Top Layer: 48.51,32.84 57.22,32.84 57.22,21.02 48.51,21.02
MOTOR2-B on Top Layer: 48.79,20.16 57.22,20.16 57.22,9.85 48.79,9.85

Small or netless copper shapes (teardrops, artwork), in the pictures only: 74 on Top Layer, 19 on Bottom Layer

## Text on the board
Top Solder Mask Layer: 中原工学院 智能视觉组 / 逐鹿-我和小车一起转队 / 2025.6.9
Top Silkscreen Layer: 使能指示灯 | 电源 | PWM2 | PWM1 | G | DIR1 | DIR2 | M1-B | M1-A | M2-A | M2-B | 关 | 开 | 正 | 负
